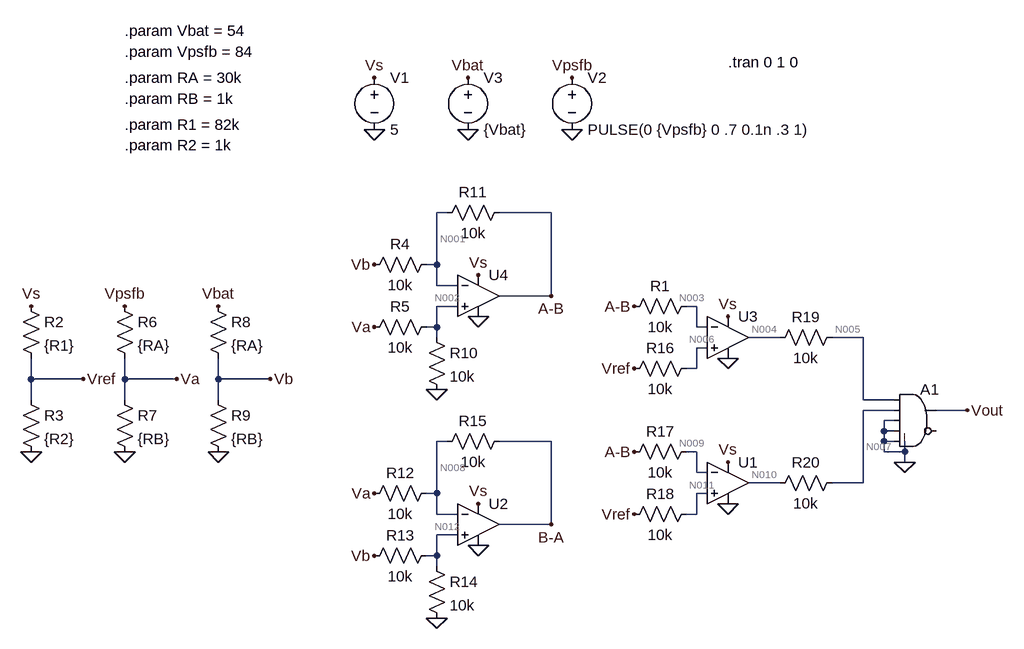
[diagram p0: schematic COMP_Vbat_v_Vpsfb_Operation.asc]
COMP_Vbat_v_Vpsfb_Operation.asc, the LTspice schematic file:
Version 4.1
SHEET 1 1048 996
WIRE 176 -144 160 -144
WIRE 336 -144 256 -144
WIRE 160 -64 160 -144
WIRE 160 -64 144 -64
WIRE 160 -32 160 -64
WIRE 192 -32 160 -32
WIRE 336 -16 336 -144
WIRE 336 -16 256 -16
WIRE 192 0 160 0
WIRE 560 0 544 0
WIRE 160 32 160 0
WIRE 160 32 144 32
WIRE 560 32 560 0
WIRE 576 32 560 32
WIRE 160 48 160 32
WIRE 688 48 640 48
WIRE 816 48 768 48
WIRE 576 64 560 64
WIRE 560 96 560 64
WIRE 560 96 544 96
WIRE -464 112 -464 80
WIRE -384 112 -464 112
WIRE -320 112 -320 80
WIRE -240 112 -320 112
WIRE -176 112 -176 80
WIRE -96 112 -176 112
WIRE -464 144 -464 112
WIRE -320 144 -320 112
WIRE -176 144 -176 112
WIRE 816 144 816 48
WIRE 864 144 816 144
WIRE 864 160 816 160
WIRE 976 160 928 160
WIRE 864 176 848 176
WIRE 848 192 848 176
WIRE 864 192 848 192
WIRE 176 208 160 208
WIRE 336 208 256 208
WIRE 848 208 848 192
WIRE 864 208 848 208
WIRE 560 224 544 224
WIRE 848 224 848 208
WIRE 880 224 880 208
WIRE 880 224 848 224
WIRE 880 240 880 224
WIRE 560 256 560 224
WIRE 576 256 560 256
WIRE 688 272 640 272
WIRE 816 272 816 160
WIRE 816 272 768 272
WIRE 160 288 160 208
WIRE 160 288 144 288
WIRE 576 288 560 288
WIRE 160 320 160 288
WIRE 192 320 160 320
WIRE 560 320 560 288
WIRE 560 320 544 320
WIRE 336 336 336 208
WIRE 336 336 256 336
WIRE 192 352 160 352
WIRE 160 384 160 352
WIRE 160 384 144 384
WIRE 160 400 160 384
FLAG 64 -272 0
FLAG 64 -352 Vs
FLAG 608 16 Vs
FLAG 608 80 0
FLAG 368 -272 0
FLAG 368 -352 Vpsfb
FLAG 208 -272 0
FLAG 208 -352 Vbat
FLAG -176 224 0
FLAG -176 0 Vbat
FLAG -320 224 0
FLAG -320 0 Vpsfb
FLAG -464 224 0
FLAG -464 0 Vs
FLAG -384 112 Vref
FLAG -240 112 Va
FLAG -96 112 Vb
FLAG 160 128 0
FLAG 64 32 Va
FLAG 64 -64 Vb
FLAG 160 480 0
FLAG 224 304 Vs
FLAG 224 368 0
FLAG 64 288 Va
FLAG 64 384 Vb
FLAG 224 -48 Vs
FLAG 224 16 0
FLAG 336 -16 A-B
FLAG 336 336 B-A
FLAG 464 96 Vref
FLAG 464 0 A-B
FLAG 880 240 0
FLAG 976 160 Vout
FLAG 608 240 Vs
FLAG 608 304 0
FLAG 464 320 Vref
FLAG 464 224 A-B
SYMBOL voltage 64 -368 R0
WINDOW 123 0 0 Left 0
WINDOW 39 0 0 Left 0
SYMATTR InstName V1
SYMATTR Value 5
SYMBOL voltage 368 -368 R0
WINDOW 123 0 0 Left 0
WINDOW 39 0 0 Left 0
SYMATTR InstName V2
SYMATTR Value PULSE(0 {Vpsfb} 0 .7 0.1n .3 1)
SYMBOL voltage 208 -368 R0
WINDOW 123 0 0 Left 0
WINDOW 39 0 0 Left 0
SYMATTR InstName V3
SYMATTR Value {Vbat}
SYMBOL res -192 -16 R0
SYMATTR InstName R8
SYMATTR Value {RA}
SYMBOL res -192 128 R0
SYMATTR InstName R9
SYMATTR Value {RB}
SYMBOL res -336 -16 R0
SYMATTR InstName R6
SYMATTR Value {RA}
SYMBOL res -336 128 R0
SYMATTR InstName R7
SYMATTR Value {RB}
SYMBOL res -480 -16 R0
SYMATTR InstName R2
SYMATTR Value {R1}
SYMBOL res -480 128 R0
SYMATTR InstName R3
SYMATTR Value {R2}
SYMBOL res 160 -80 R90
WINDOW 0 0 56 VBottom 2
WINDOW 3 32 56 VTop 2
SYMATTR InstName R4
SYMATTR Value 10k
SYMBOL res 160 16 R90
WINDOW 0 0 56 VBottom 2
WINDOW 3 32 56 VTop 2
SYMATTR InstName R5
SYMATTR Value 10k
SYMBOL res 144 32 R0
SYMATTR InstName R10
SYMATTR Value 10k
SYMBOL res 272 -160 R90
WINDOW 0 0 56 VBottom 2
WINDOW 3 32 56 VTop 2
SYMATTR InstName R11
SYMATTR Value 10k
SYMBOL res 160 272 R90
WINDOW 0 0 56 VBottom 2
WINDOW 3 32 56 VTop 2
SYMATTR InstName R12
SYMATTR Value 10k
SYMBOL res 160 368 R90
WINDOW 0 0 56 VBottom 2
WINDOW 3 32 56 VTop 2
SYMATTR InstName R13
SYMATTR Value 10k
SYMBOL res 144 384 R0
SYMATTR InstName R14
SYMATTR Value 10k
SYMBOL res 272 192 R90
WINDOW 0 0 56 VBottom 2
WINDOW 3 32 56 VTop 2
SYMATTR InstName R15
SYMATTR Value 10k
SYMBOL OpAmps\\UniversalOpAmp2 224 -16 R0
SYMATTR InstName U4
SYMBOL OpAmps\\UniversalOpAmp2 224 336 R0
SYMATTR InstName U2
SYMBOL OpAmps\\UniversalOpAmp2 608 48 R0
SYMATTR InstName U3
SYMBOL Digital\\and 896 112 R0
SYMATTR InstName A1
SYMBOL res 560 -16 R90
WINDOW 0 0 56 VBottom 2
WINDOW 3 32 56 VTop 2
SYMATTR InstName R1
SYMATTR Value 10k
SYMBOL res 560 80 R90
WINDOW 0 0 56 VBottom 2
WINDOW 3 32 56 VTop 2
SYMATTR InstName R16
SYMATTR Value 10k
SYMBOL OpAmps\\UniversalOpAmp2 608 272 R0
SYMATTR InstName U1
SYMBOL res 560 208 R90
WINDOW 0 0 56 VBottom 2
WINDOW 3 32 56 VTop 2
SYMATTR InstName R17
SYMATTR Value 10k
SYMBOL res 560 304 R90
WINDOW 0 0 56 VBottom 2
WINDOW 3 32 56 VTop 2
SYMATTR InstName R18
SYMATTR Value 10k
SYMBOL res 784 32 R90
WINDOW 0 0 56 VBottom 2
WINDOW 3 32 56 VTop 2
SYMATTR InstName R19
SYMATTR Value 10k
SYMBOL res 784 256 R90
WINDOW 0 0 56 VBottom 2
WINDOW 3 32 56 VTop 2
SYMATTR InstName R20
SYMATTR Value 10k
TEXT 608 -376 Left 2 !.tran 0 1 0
TEXT -320 -352 Left 2 !.param RA = 30k
TEXT -320 -320 Left 2 !.param RB = 1k
TEXT -320 -280 Left 2 !.param R1 = 82k
TEXT -320 -248 Left 2 !.param R2 = 1k
TEXT -320 -424 Left 2 !.param Vbat = 54
TEXT -320 -392 Left 2 !.param Vpsfb = 84

The netlist it stands for:
* COMP_Vbat_v_Vpsfb_Operation.asc
V1 Vs 0 5
V2 Vpsfb 0 PULSE(0 {Vpsfb} 0 .7 0.1n .3 1)
V3 Vbat 0 {Vbat}
R8 Vbat Vb {RA}
R9 Vb 0 {RB}
R6 Vpsfb Va {RA}
R7 Va 0 {RB}
R2 Vs Vref {R1}
R3 Vref 0 {R2}
R4 N001 Vb 10k
R5 N002 Va 10k
R10 N002 0 10k
R11 A-B N001 10k
R12 N008 Va 10k
R13 N012 Vb 10k
R14 N012 0 10k
R15 B-A N008 10k
X§U4 N002 N001 Vs 0 A-B level2 Avol=1Meg GBW=10Meg Slew=10Meg Ilimit=25m Rail=0 Vos=0 En=0 Enk=0 In=0 Ink=0 Rin=500Meg  ; pins In+ In- V+ V- OUT
X§U2 N012 N008 Vs 0 B-A level2 Avol=1Meg GBW=10Meg Slew=10Meg Ilimit=25m Rail=0 Vos=0 En=0 Enk=0 In=0 Ink=0 Rin=500Meg  ; pins In+ In- V+ V- OUT
X§U3 N006 N003 Vs 0 N004 level2 Avol=1Meg GBW=10Meg Slew=10Meg Ilimit=25m Rail=0 Vos=0 En=0 Enk=0 In=0 Ink=0 Rin=500Meg  ; pins In+ In- V+ V- OUT
A1 N005 N007 0 0 0 0 Vout 0 AND
R1 N003 A-B 10k
R16 N006 Vref 10k
X§U1 N011 N009 Vs 0 N010 level2 Avol=1Meg GBW=10Meg Slew=10Meg Ilimit=25m Rail=0 Vos=0 En=0 Enk=0 In=0 Ink=0 Rin=500Meg  ; pins In+ In- V+ V- OUT
R17 N009 A-B 10k
R18 N011 Vref 10k
R19 N005 N004 10k
R20 N007 N010 10k
.tran 0 1 0
.param RA = 30k
.param RB = 1k
.param R1 = 82k
.param R2 = 1k
.param Vbat = 54
.param Vpsfb = 84
.lib UniversalOpAmp2.lib
.backanno
.end

* Results of the author's LTspice run, read from the files saved beside the schematic
* Operating Point, zero values left out:
*   V(vb) = 1.588 V
*   V(va) = 67.11 mV
*   V(n001) = 794.6 mV
*   V(n008) = 794.2 mV
*   V(b-a) = 1.521 V
*   V(n006) = 60.3 mV
*   V(n004) = 5 V
*   V(vout) = 1 V
*   V(n009) = 877.5 µV
*   V(vs) = 5 V
*   V(vbat) = 54 V
*   V(vref) = 60.25 mV
*   V(n002) = 33.58 mV
*   V(a-b) = 827.6 µV
*   V(n012) = 794.2 mV
*   V(n003) = 877.5 µV
*   V(n005) = 5 V
*   V(n007) = 5 V
*   V(n011) = 60.3 mV
*   V(n010) = 5 V
*   I(V1) = -331.1 µA
*   I(R9) = 1.588 mA
*   I(R6) = -2.237 µA
*   I(R2) = 60.24 µA
*   I(R5) = -3.353 µA
*   I(R11) = -79.37 µA
*   I(R12) = 72.7 µA
*   I(R14) = 79.42 µA
*   I(V3) = -1.747 mA
*   I(R17) = 4.998 nA
*   I(R18) = 4.879 nA
*   I(R8) = 1.747 mA
*   I(R7) = 67.11 µA
*   I(R3) = 60.25 µA
*   I(R4) = -79.37 µA
*   I(R10) = 3.358 µA
*   I(R13) = -79.41 µA
*   I(R15) = 72.7 µA
*   I(V2) = 2.237 µA
*   I(R1) = 4.998 nA
*   I(R16) = 4.879 nA
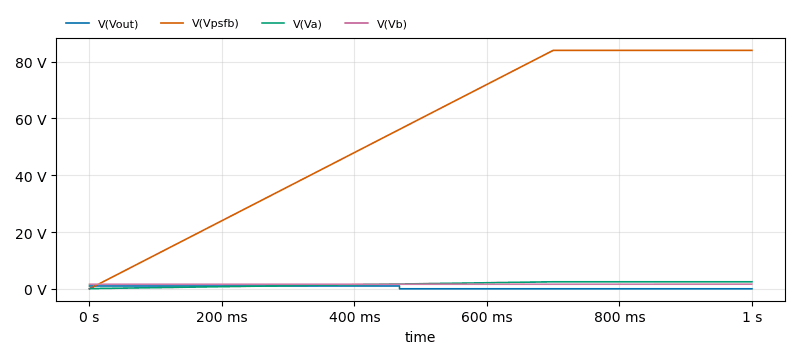
[diagram p1: Transient Analysis of COMP_Vbat_v_Vpsfb_Operation.asc, plotted from the saved traces]
* Transient Analysis, 1 run:
*   V(Vout): min 0 V, max 1 V, average 468 mV, rms 684.1 mV, last 0 V
*   V(Vpsfb): min 0 V, max 84 V, average 54.6 V, rms 61.44 V, last 84 V
*   V(Va): min 67.11 mV, max 2.471 V, average 1.621 V, rms 1.812 V, last 2.471 V
*   V(Vb): min 1.588 V, max 1.626 V, average 1.604 V, rms 1.604 V, last 1.626 V